# Altium schematic sheet 3_mcu.SchDoc
size A4; SheetNumber: 3; SheetTotal: 6
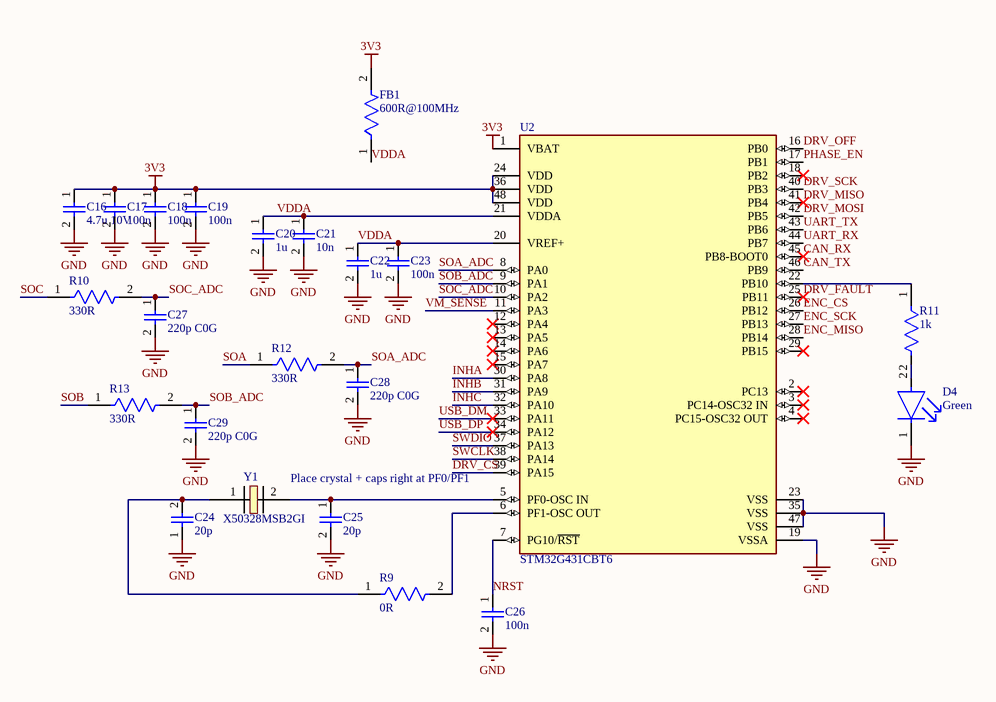
[diagram p0: 3_mcu.SchDoc]

## Parts
C16  4.7u 10V  [RES_0603]
C17  100n  [RES_0603]
C18  100n  [RES_0603]
C19  100n  [RES_0603]
C20  1u  [RES_0603]
C21  10n  [RES_0603]
C22  1u  [RES_0603]
C23  100n  [RES_0603]
C24  20p  [RES_0603]
C25  20p  [RES_0603]
C26  100n  [RES_0603]
C27  220p C0G  [RES_0603]
C28  220p C0G  [RES_0603]
C29  220p C0G  [RES_0603]
D4  Green  [LED_0603]
FB1  600R@100MHz  [RES_0603]
R9  0R  [RES_0603]
R10  330R  [RES_0603]
R11  1k  [RES_0603]
R12  330R  [RES_0603]
R13  330R  [RES_0603]
U2  STM32G431CBT6  [FP-LQFP48-5B-MFG]
Y1  X50328MSB2GI  [Crystal_5032_2P_YXC]

## Nets
3V3: C16.1 C17.1 C18.1 C19.1 FB1.2 U2.1(VBAT) U2.24(VDD) U2.36(VDD) U2.48(VDD)
GND: C16.2 C17.2 C18.2 C19.2 C20.2 C21.2 C22.2 C23.2 C24.1 C25.2 C26.2 C27.2 C28.2 C29.2 D4.1(C) U2.19(VSSA) U2.23(VSS) U2.35(VSS) U2.47(VSS)
CAN_RX: U2.45(PB8-BOOT0)
CAN_TX: U2.46(PB9)
DRV_CS: U2.39(PA15)
DRV_FAULT: U2.25(PB11)
DRV_MISO: U2.41(PB4)
DRV_MOSI: U2.42(PB5)
DRV_OFF: U2.16(PB0)
DRV_SCK: U2.40(PB3)
ENC_CS: U2.26(PB12)
ENC_MISO: U2.28(PB14)
ENC_SCK: U2.27(PB13)
INHA: U2.30(PA8)
INHB: U2.31(PA9)
INHC: U2.32(PA10)
NRST: C26.1 U2.7(PG10/~{RST})
PHASE_EN: U2.17(PB1)
SOA: R12.1
SOA_ADC: C28.1 R12.2 U2.8(PA0)
SOB: R13.1
SOB_ADC: C29.1 R13.2 U2.9(PA1)
SOC: R10.1
SOC_ADC: C27.1 R10.2 U2.10(PA2)
SWCLK: U2.38(PA14)
SWDIO: U2.37(PA13)
UART_RX: U2.44(PB7)
UART_TX: U2.43(PB6)
USB_DM: U2.33(PA11)
USB_DP: U2.34(PA12)
VDDA: C20.1 C21.1 C22.1 C23.1 FB1.1 U2.20(VREF+) U2.21(VDDA)
VM_SENSE: U2.11(PA3)
NetC24_2: C24.2 R9.1 Y1.1
NetC25_1: C25.1 U2.5(PF0-OSC_IN) Y1.2
NetD4_2: D4.2(A) R11.2
NetR9_2: R9.2 U2.6(PF1-OSC_OUT)
NetR11_1: R11.1 U2.22(PB10)

Not connected (* = marked no-connect by the designer): U2 2(PC13)* 3(PC14-OSC32_IN)* 4(PC15-OSC32_OUT)* 12(PA4)* 13(PA5)* 14(PA6)* 15(PA7)* 18(PB2)* 29(PB15)*

## Notes on the sheet
- (near U2) Place crystal + caps right at PF0/PF1

## Library data of the parts
C16-C29 = CAP_0603: Capacitor, 0603
  C16: Value: 4.7u 10V
  C17-C19 C23 C26: Value: 100n
  C20 C22: Value: 1u
  C21: Value: 10n
  C24 C25: Value: 20p
  C27-C29: Value: 220p C0G
D4 = LED_0603: LED, 0603; NexarPartId: 549907; Forward Voltage: 2V; Viewing Angle: 130°; Lens Transparency: Clear; Power Rating: 75mW; Number of LEDs: 1; Luminous Intensity: 35mcd; Forward Current: 20mA; Dominant Wavelength: 571nm; Lens Color: Clear, Colorless; Reverse Voltage: 5V; Wavelength: 574nm; Number of Pins: 2; Packaging: Tape and Reel; Number of Elements: 1; Schedule B: 8541402000, 8541402000|8541402000|8541402000|8541402000|8541402000; Height: 550µm; Case/Package: 0603; Illumination Color: Green; Depth: 800µm; Max Operating Temperature: 85°C; RoHS: Compliant; Lens Style: Clear; Lead Free: Lead Free; Length: 1.6mm; Mount: Surface Mount; Test Current: 20mA; Width: 800µm; Case Code (Imperial): 0603; Min Operating Temperature: -55°C; Case Code (Metric): 1608; Radiation Hardening: No; Power Dissipation: 75mW; Color: Green; Value: Green
FB1 = FB_0603: Ferrite bead, 0603; Value: 600R@100MHz
R9-R13 = RES_0603: Resistor, 0603
  R9: Value: 0R
  R10 R12 R13: Value: 330R
  R11: Value: 1k
U2 = STM32G431CBT6: MAINSTREAM ARM CORTEX-M4+ MCU 17; Manufacturer: STMicroelectronics; Number Of Adc Channels: 17; Number Of I/Os: 38; Standoff Height: 0.05mm; Number Of Usb Channels: 1; Data Bus Width: 32bits; Number Of I2C Channels: 3; Number Of Pwm Channels: 31; Frequency: 170MHz; Memory Type: FLASH; Number Of Timers/Counters: 14; Ram Size: 32KBytes; Max Junction Temp: +105°C; Memory Size: 128KBytes; Min Supply Voltage: 1.62V; Max Supply Voltage: 3.6V; Number Of Uart Channels: 4; Interface: I2C,SPI,UART,USART,CAN,USB,LIN,IrDA,I2S; Temperature Range Low: -40°C; Lead Free: Yes; Device Class L3: Microcontrollers; Number Of Cores: 1; Temperature Range High: +85°C; Height: 1.6mm; Digikey Description: MAINSTREAM ARM CORTEX-M4+ MCU 17; Device Class L1: Integrated Circuits (ICs); Package: LQFP48-5B; RoHS: TRUE; Number Of A/D Converters: 1; Core Architecture: Arm Cortex-M4; Device Class L2: Embedded Processors and Controllers; ComponentLink2Description: Datasheet; Temperature: -40°C to +85°C; Ambient Temperature Range High: +85°C; Ambient Temperature Range Low: -40°C; Octopart: https://octopart.com/stm32g431cbt6-stmicroelectronics-98835224; ComponentLink2URL: https://www.st.com/resource/en/datasheet/stm32g431cb.pdf; Automotive: No; Number Of Spi Channels: 3; Manufacturer Part Number: STM32G431CBT6; Category: IC
Y1 = X50328MSB2GI: 8 MHz crystal, 5032, 2-pad